# EAGLE design cpu2-c (EAGLE 4.13)
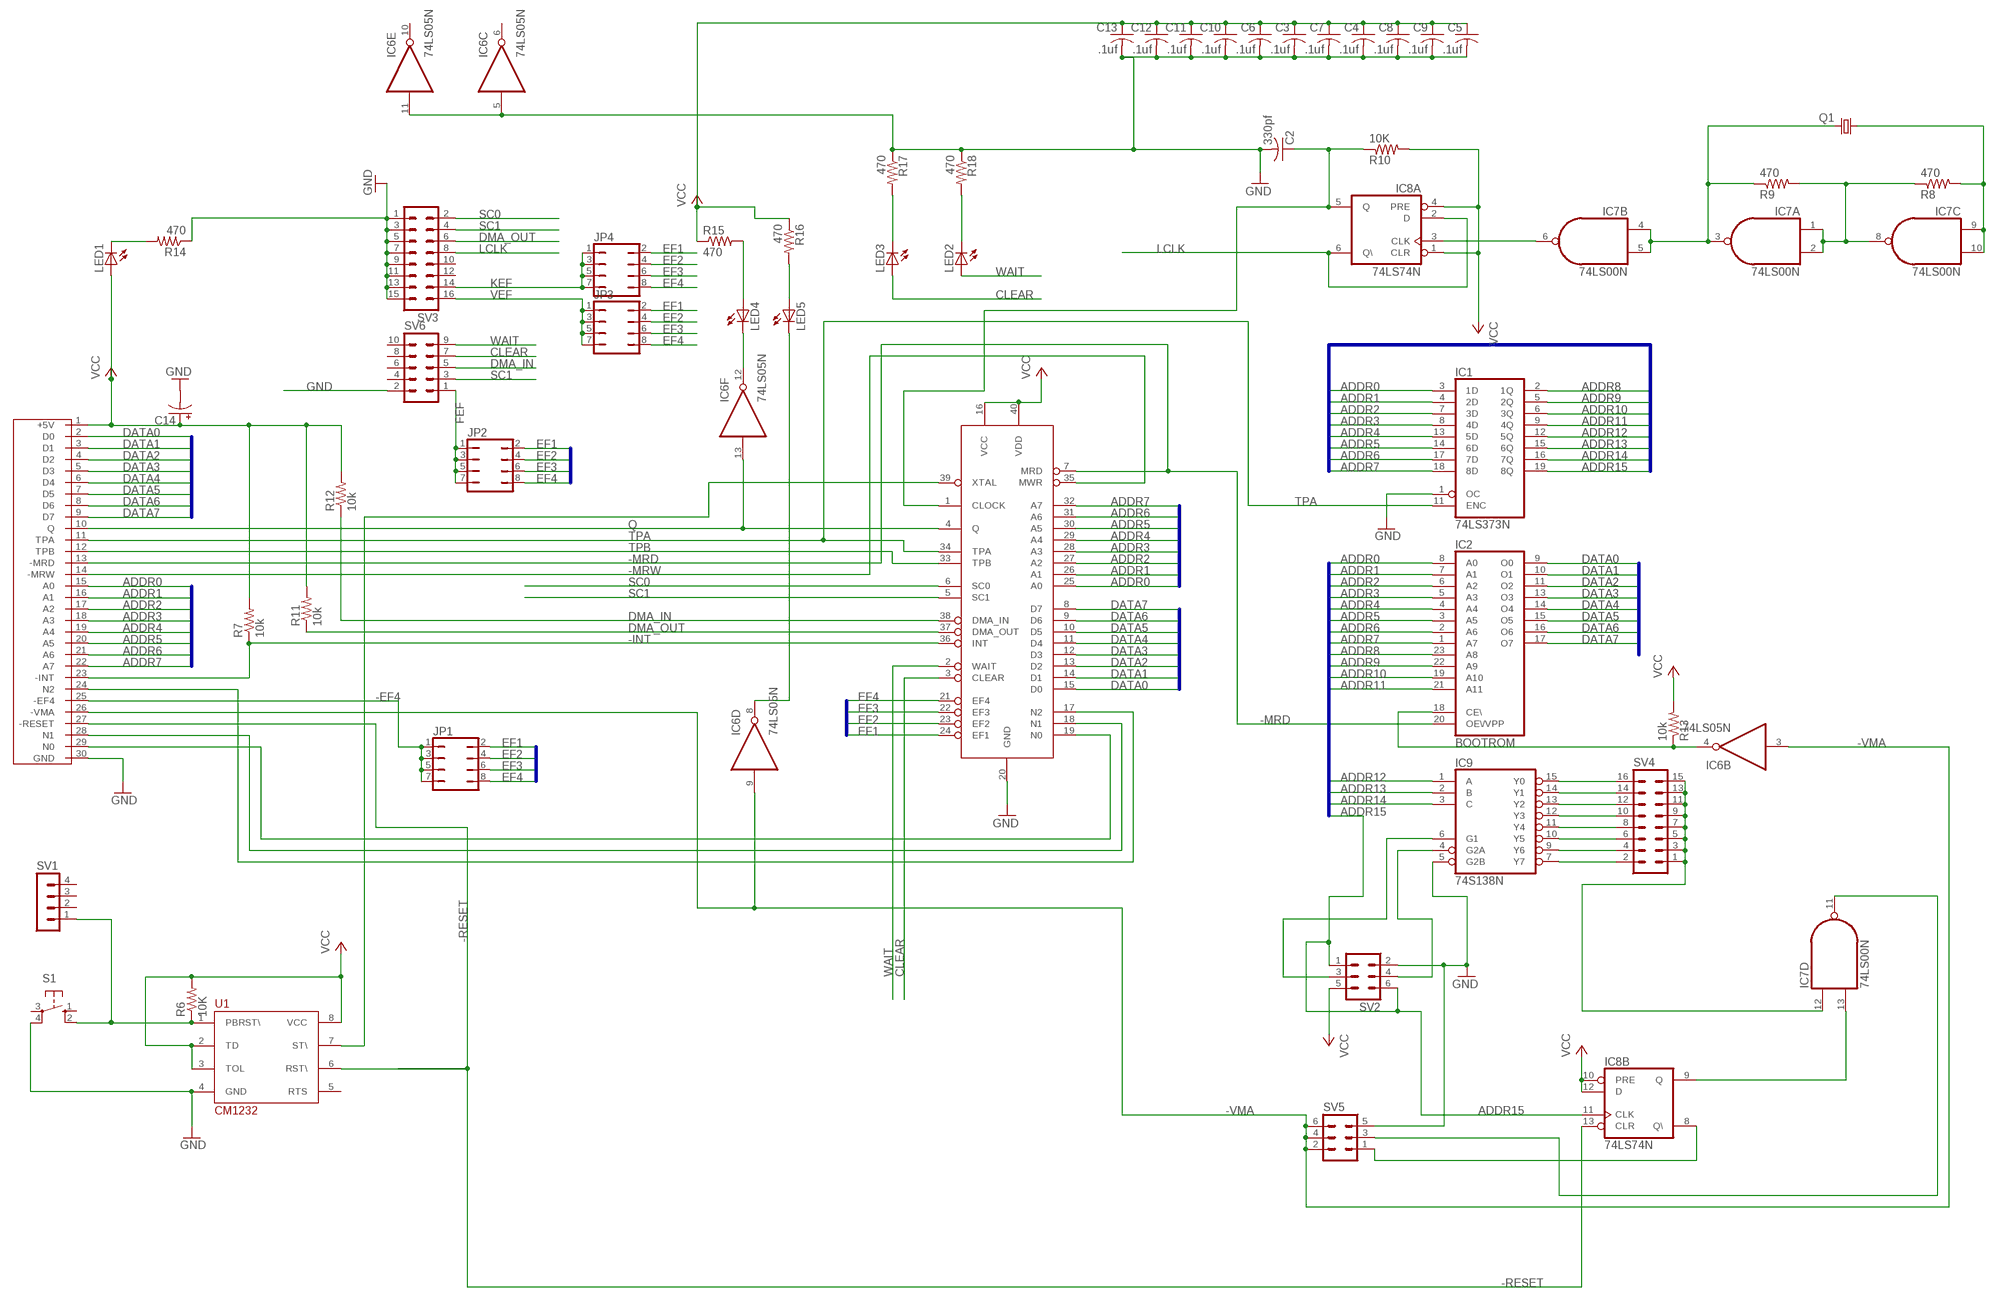
[diagram p0: schematic, sheet 1]

## Parts
C2  330pf  C-US025-025X050  [C025-025X050]
C3  .1uf  C-US025-050X050  [C025-050X050]
C4  .1uf  C-US025-050X050  [C025-050X050]
C5  .1uf  C-US025-050X050  [C025-050X050]
C6  .1uf  C-US025-050X050  [C025-050X050]
C7  .1uf  C-US025-050X050  [C025-050X050]
C8  .1uf  C-US025-050X050  [C025-050X050]
C9  .1uf  C-US025-050X050  [C025-050X050]
C10  .1uf  C-US025-050X050  [C025-050X050]
C11  .1uf  C-US025-050X050  [C025-050X050]
C12  .1uf  C-US025-050X050  [C025-050X050]
C13  .1uf  C-US025-050X050  [C025-050X050]
C14  CPOL-USE2.5-7  [E2,5-7]
IC1  74LS373N  [DIL20]
IC2  BOOTROM  2732  [DIL24]
IC6  74LS05N  [DIL14]
IC7  74LS00N  [DIL14]
IC8  74LS74N  [DIL14]
IC9  74S138N  [DIL16]
JP1  JP4Q  [JP4Q]
JP2  JP4Q  [JP4Q]
JP3  JP4Q  [JP4Q]
JP4  JP4Q  [JP4Q]
LED1  LED5MM  [LED5MM]
LED2  LED5MM  [LED5MM]
LED3  LED5MM  [LED5MM]
LED4  LED5MM  [LED5MM]
LED5  LED5MM  [LED5MM]
Q1  CRYTALHC49U70  [HC49U70]
R6  10K  R-US_0207/2V  [0207/2V]
R7  10k  R-US_0207/2V  [0207/2V]
R8  470  R-US_0207/2V  [0207/2V]
R9  470  R-US_0207/2V  [0207/2V]
R10  10K  R-US_0207/2V  [0207/2V]
R11  10k  R-US_0207/2V  [0207/2V]
R12  10k  R-US_0207/2V  [0207/2V]
R13  10k  R-US_0207/2V  [0207/2V]
R14  470  R-US_0207/7  [0207/7]
R15  470  R-US_0207/7  [0207/7]
R16  470  R-US_0207/7  [0207/7]
R17  470  R-US_0207/7  [0207/7]
R18  470  R-US_0207/7  [0207/7]
S1  10-XX  [B3F-10XX]
SV1  MA04-1  [MA04-1]
SV2  MA03-2  [MA03-2]
SV3  MA08-2  [MA08-2]
SV4  MA08-2  [MA08-2]
SV5  MA03-2  [MA03-2]
SV6  MA05-2  [MA05-2]
U1  CM1232  [DIP-8]
U$1  CDP1802BCECDP1802BCE  [DIL40]
U$2  C30  [C30]

## Nets
-EF4: JP1.1 JP1.3 JP1.5 JP1.7 U$2.25(-EF4)
-INT: R7.1 U$1.36(INT) U$2.23(-INT)
-MRD: IC2.20(OE\/VPP) U$1.7(MRD) U$2.13(-MRD)
-MRW: U$1.35(MWR) U$2.14(-MRW)
-RESET: IC8.13(B:CLR) U1.6(RST\) U$2.27(-RESET)
-VMA: IC6.3(B:I) IC6.9(D:I) SV5.2 SV5.4 SV5.6 U$2.26(-VMA)
ADDR0: IC1.3(1D) IC2.8(A0) U$1.25(A0) U$2.15(A0)
ADDR1: IC1.4(2D) IC2.7(A1) U$1.26(A1) U$2.16(A1)
ADDR2: IC1.7(3D) IC2.6(A2) U$1.27(A2) U$2.17(A2)
ADDR3: IC1.8(4D) IC2.5(A3) U$1.28(A3) U$2.18(A3)
ADDR4: IC1.13(5D) IC2.4(A4) U$1.29(A4) U$2.19(A4)
ADDR5: IC1.14(6D) IC2.3(A5) U$1.30(A5) U$2.20(A5)
ADDR6: IC1.17(7D) IC2.2(A6) U$1.31(A6) U$2.21(A6)
ADDR7: IC1.18(8D) IC2.1(A7) U$1.32(A7) U$2.22(A7)
ADDR8: IC1.2(1Q) IC2.23(A8)
ADDR9: IC1.5(2Q) IC2.22(A9)
ADDR10: IC1.6(3Q) IC2.19(A10)
ADDR11: IC1.9(4Q) IC2.21(A11)
ADDR12: IC1.12(5Q) IC9.1(A)
ADDR13: IC1.15(6Q) IC9.2(B)
ADDR14: IC1.16(7Q) IC9.3(C)
ADDR15: IC1.19(8Q) IC8.11(B:CLK) SV2.1 SV2.6
CLEAR: LED3.A SV6.7 U$1.3(CLEAR)
DATA0: IC2.9(O0) U$1.15(D0) U$2.2(D0)
DATA1: IC2.10(O1) U$1.14(D1) U$2.3(D1)
DATA2: IC2.11(O2) U$1.13(D2) U$2.4(D2)
DATA3: IC2.13(O3) U$1.12(D3) U$2.5(D3)
DATA4: IC2.14(O4) U$1.11(D4) U$2.6(D4)
DATA5: IC2.15(O5) U$1.10(D5) U$2.7(D5)
DATA6: IC2.16(O6) U$1.9(D6) U$2.8(D6)
DATA7: IC2.17(O7) U$1.8(D7) U$2.9(D7)
DMA_IN: R12.1 SV6.5 U$1.38(DMA_IN)
DMA_OUT: R11.1 SV3.6 U$1.37(DMA_OUT)
EF1: JP1.2 JP2.2 JP3.2 JP4.2 U$1.24(EF1)
EF2: JP1.4 JP2.4 JP3.4 JP4.4 U$1.23(EF2)
EF3: JP1.6 JP2.6 JP3.6 JP4.6 U$1.22(EF3)
EF4: JP1.8 JP2.8 JP3.8 JP4.8 U$1.21(EF4)
FEF: JP2.1 JP2.3 JP2.5 JP2.7 SV6.1
GND: C2.2 C3.2 C4.2 C5.2 C6.2 C7.2 C8.2 C9.2 C10.2 C11.2 C12.2 C13.2 C14.- IC1.1(OC) IC6.5(C:I) IC6.11(E:I) IC9.5(G2B) R14.1 R17.1 R18.1 S1.4(P1) SV2.2 SV3.1 SV3.3 SV3.5 SV3.7 SV3.9 SV3.11 SV3.13 SV3.15 SV5.5 SV6.2 U1.4(GND) U$1.20(GND) U$2.30(GND)
KEF: JP4.1 JP4.3 JP4.5 JP4.7 SV3.14
LCLK: IC8.2(A:D) IC8.6(A:Q\) SV3.8
N0: U$1.19(N0) U$2.29(N0)
N1: U$1.18(N1) U$2.28(N1)
N2: U$1.17(N2) U$2.24(N2)
N$1: IC7.11(D:O) SV5.3
N$2: R6.1 S1.2(S1) SV1.1 U1.1(PBRST\)
N$3: IC2.18(CE\) IC6.4(B:O) R13.1
N$4: IC7.13(D:I1) IC8.9(B:Q)
N$5: LED1.K(C) R14.2
N$6: IC8.8(B:Q\) SV5.1
N$7: IC6.12(F:O) LED4.K(C)
N$8: LED4.A R15.2
N$9: LED3.K(C) R17.2
N$10: LED2.K(C) R18.2
N$13: LED5.A R16.2
N$14: U1.7(ST\) U$1.39(XTAL)
N$16: IC7.1(A:I0) IC7.2(A:I1) IC7.8(C:O) R8.1 R9.2
N$18: IC7.3(A:O) IC7.4(B:I0) IC7.5(B:I1) Q1.2 R9.1
N$20: IC9.4(G2A) SV2.4
N$21: IC7.9(C:I0) IC7.10(C:I1) Q1.1 R8.2
N$23: IC7.6(B:O) IC8.3(A:CLK)
N$25: IC6.8(D:O) LED5.K(C)
N$27: C2.1 IC8.5(A:Q) R10.1 U$1.1(CLOCK)
N$29: IC9.15(Y0) SV4.16
N$30: IC9.14(Y1) SV4.14
N$31: IC9.13(Y2) SV4.12
N$32: IC9.12(Y3) SV4.10
N$33: IC9.11(Y4) SV4.8
N$34: IC9.10(Y5) SV4.6
N$35: IC9.9(Y6) SV4.4
N$36: IC9.7(Y7) SV4.2
N$37: IC7.12(D:I0) SV4.1 SV4.3 SV4.5 SV4.7 SV4.9 SV4.11 SV4.13 SV4.15
N$38: IC9.6(G1) SV2.3
Q: IC6.13(F:I) U$1.4(Q) U$2.10(Q)
SC0: SV3.2 U$1.6(SC0)
SC1: SV3.4 SV6.3 U$1.5(SC1)
TPA: IC1.11(ENC) U$1.34(TPA) U$2.11(TPA)
TPB: U$1.33(TPB) U$2.12(TPB)
VCC: C3.1 C4.1 C5.1 C6.1 C7.1 C8.1 C9.1 C10.1 C11.1 C12.1 C13.1 C14.+ IC8.1(A:CLR) IC8.4(A:PRE) IC8.10(B:PRE) IC8.12(B:D) LED1.A R6.2 R7.2 R10.2 R11.2 R12.2 R13.2 R15.1 R16.1 SV2.5 U1.2(TD) U1.3(TOL) U1.8(VCC) U$1.16(VCC) U$1.40(VDD) U$2.1(+5V)
VEF: JP3.1 JP3.3 JP3.5 JP3.7 SV3.16
WAIT: LED2.A SV6.9 U$1.2(WAIT)
Unconnected: IC6.1(A:I) IC6.2(A:O) IC6.6(C:O) IC6.10(E:O) S1.1(S) S1.3(P) SV1.2 SV1.3 SV1.4 SV3.10 SV3.12 SV6.4 SV6.6 SV6.8 SV6.10 U1.5(RTS)

## Buses
DATA[0..7]
ADDR[0..15]
EF[1..4]

## Power pins joined to a net without a drawn wire
GND: IC1.10(GND) IC2.12(GND) IC6.7(P:GND) IC7.7(P:GND) IC8.7(P:GND) IC9.8(GND)
VCC: IC1.20(VCC) IC2.24(VCC) IC6.14(P:VCC) IC7.14(P:VCC) IC8.14(P:VCC) IC9.16(VCC)

## Library data of the parts
C2-C13 = rcl:C-US: CAPACITOR, American symbol
C14 = rcl:CPOL-US: POLARIZED CAPACITOR, American symbol
IC1 = 74xx-us:74*373: Octal D type transparent LATCH, edge triggered
IC2 = memory:2732: MEMORY
IC6 = 74xx-us:74*05: Hex INVERTER, open collector
IC7 = 74xx-us:74*00: Quad 2-input NAND gate
IC8 = 74xx-us:74*74: Dual D type positive edge triggered FLIP FLOP, preset and clear
IC9 = 74xx-us:74*138: 3-line to 8-line DECODER/DEMULTIPLEXER
JP1-JP4 = jumper:JP4Q: JUMPER
LED1-LED5 = led:LED: LED OSRAM: - CHIPLED LG R971, LG N971, LY N971, LG Q971, LY Q971, LO R971, LY R971 LH N974, LH R974 LS Q976, LO Q976, LY Q976 LO Q996 - Hyper CHIPLED LW Q18S LB Q993, LB Q99A, LB R99A - SideLED LS A670, LO A670, LY A670, LG A670, LP A670 LB A673, LV A673, LT A673, LW A673 LH A674 LY A675 LS A676, LA A676, LO A676, LY A676, LW A676 LS A679, LY A679, LG A679 - Hyper Micro SIDELED® LS Y876, LA Y876, LO Y876, LY Y876 LT Y87S - SmartLED LW L88C, LW L88S LB L89C, LB L89S, LG L890 LS L89K, LO L89K, LY L89K LS L896, LA L896, LO L896, LY L896 - TOPLED LS T670, LO T670, LY T670, LG T670, LP T670 LSG T670, LSP T670, LSY T670, LOP T670, LYG T670 LG T671, LOG T671, LSG T671 LB T673, LV T673, LT T673, LW T673 LH T674 LS T676, LA T676, LO T676, LY T676, LB T676, LH T676, LSB T676, LW T676 LB T67C, LV T67C, LT T67C, LS T67K, LO T67K, LY T67K, LW E67C LS E67B, LA E67B, LO E67B, LY E67B, LB E67C, LV E67C, LT E67C LW T67C LS T679, LY T679, LG T679 LS T770, LO T770, LY T770, LG T770, LP T770 LB T773, LV T773, LT T773, LW T773 LH T774 LS E675, LA E675, LY E675, LS T675 LS T776, LA T776, LO T776, LY T776, LB T776 LHGB T686 LT T68C, LB T68C - Hyper Mini TOPLED® LB M676 - Mini TOPLED Santana® LG M470 LS M47K, LO M47K, LY M47K Source: http://www.osram.convergy.de/
Q1 = crystal:CRYTAL: CRYSTAL
R6-R18 = rcl:R-US_: RESISTOR, American symbol
S1 = switch-omron:10-XX: OMRON SWITCH
SV1 = con-lstb:MA04-1: PIN HEADER
SV2 SV5 = con-lstb:MA03-2: PIN HEADER
SV3 SV4 = con-lstb:MA08-2: PIN HEADER
SV6 = con-lstb:MA05-2: PIN HEADER
U1 = 65xxx:CM1232: CM1232 CMOS Microprocessor Monitor
U$1 = cdp:CDP1802BCE
U$2 = k1:C30

## Board
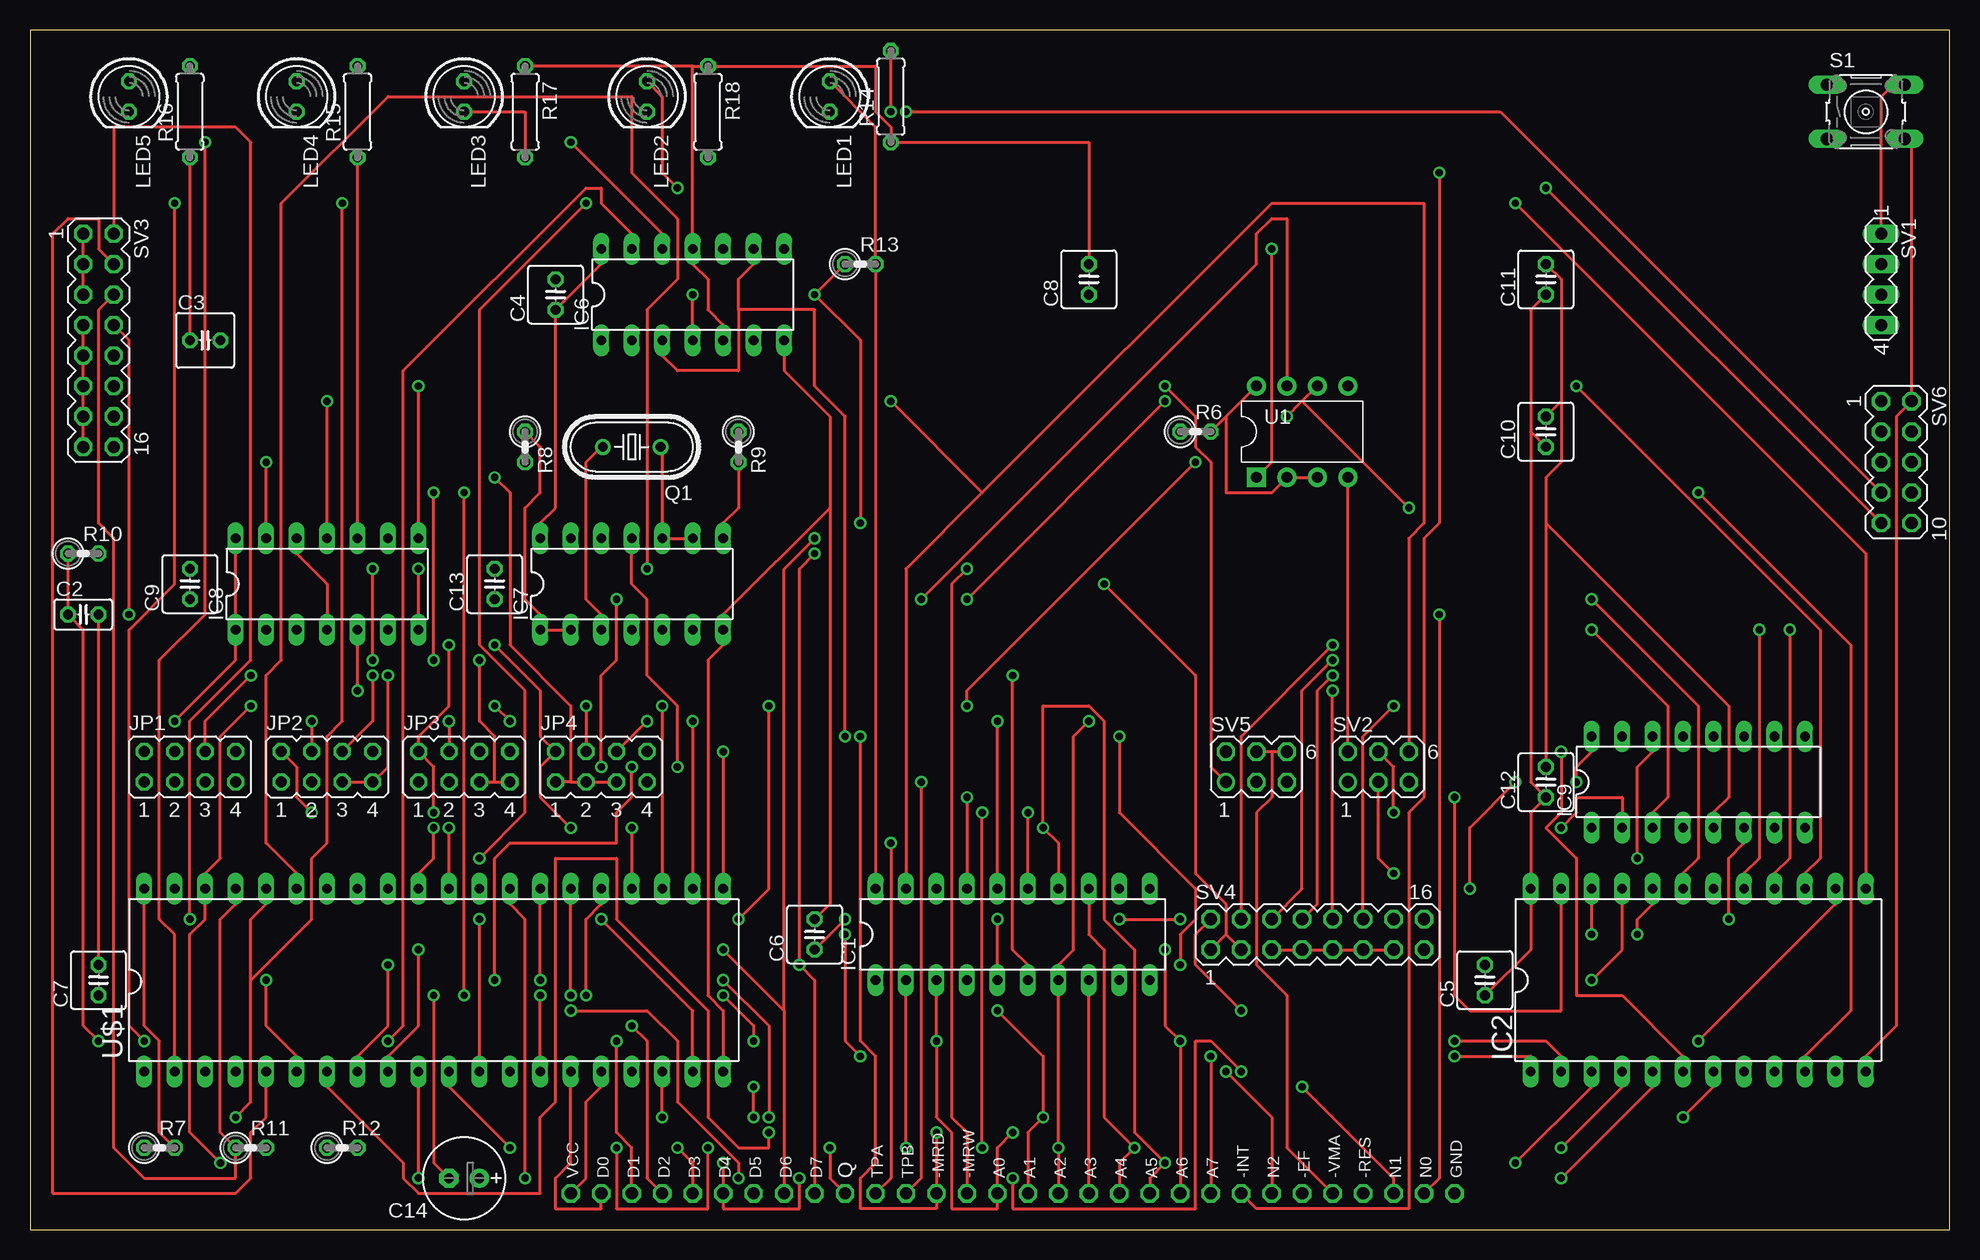
[diagram p1: board, top side]
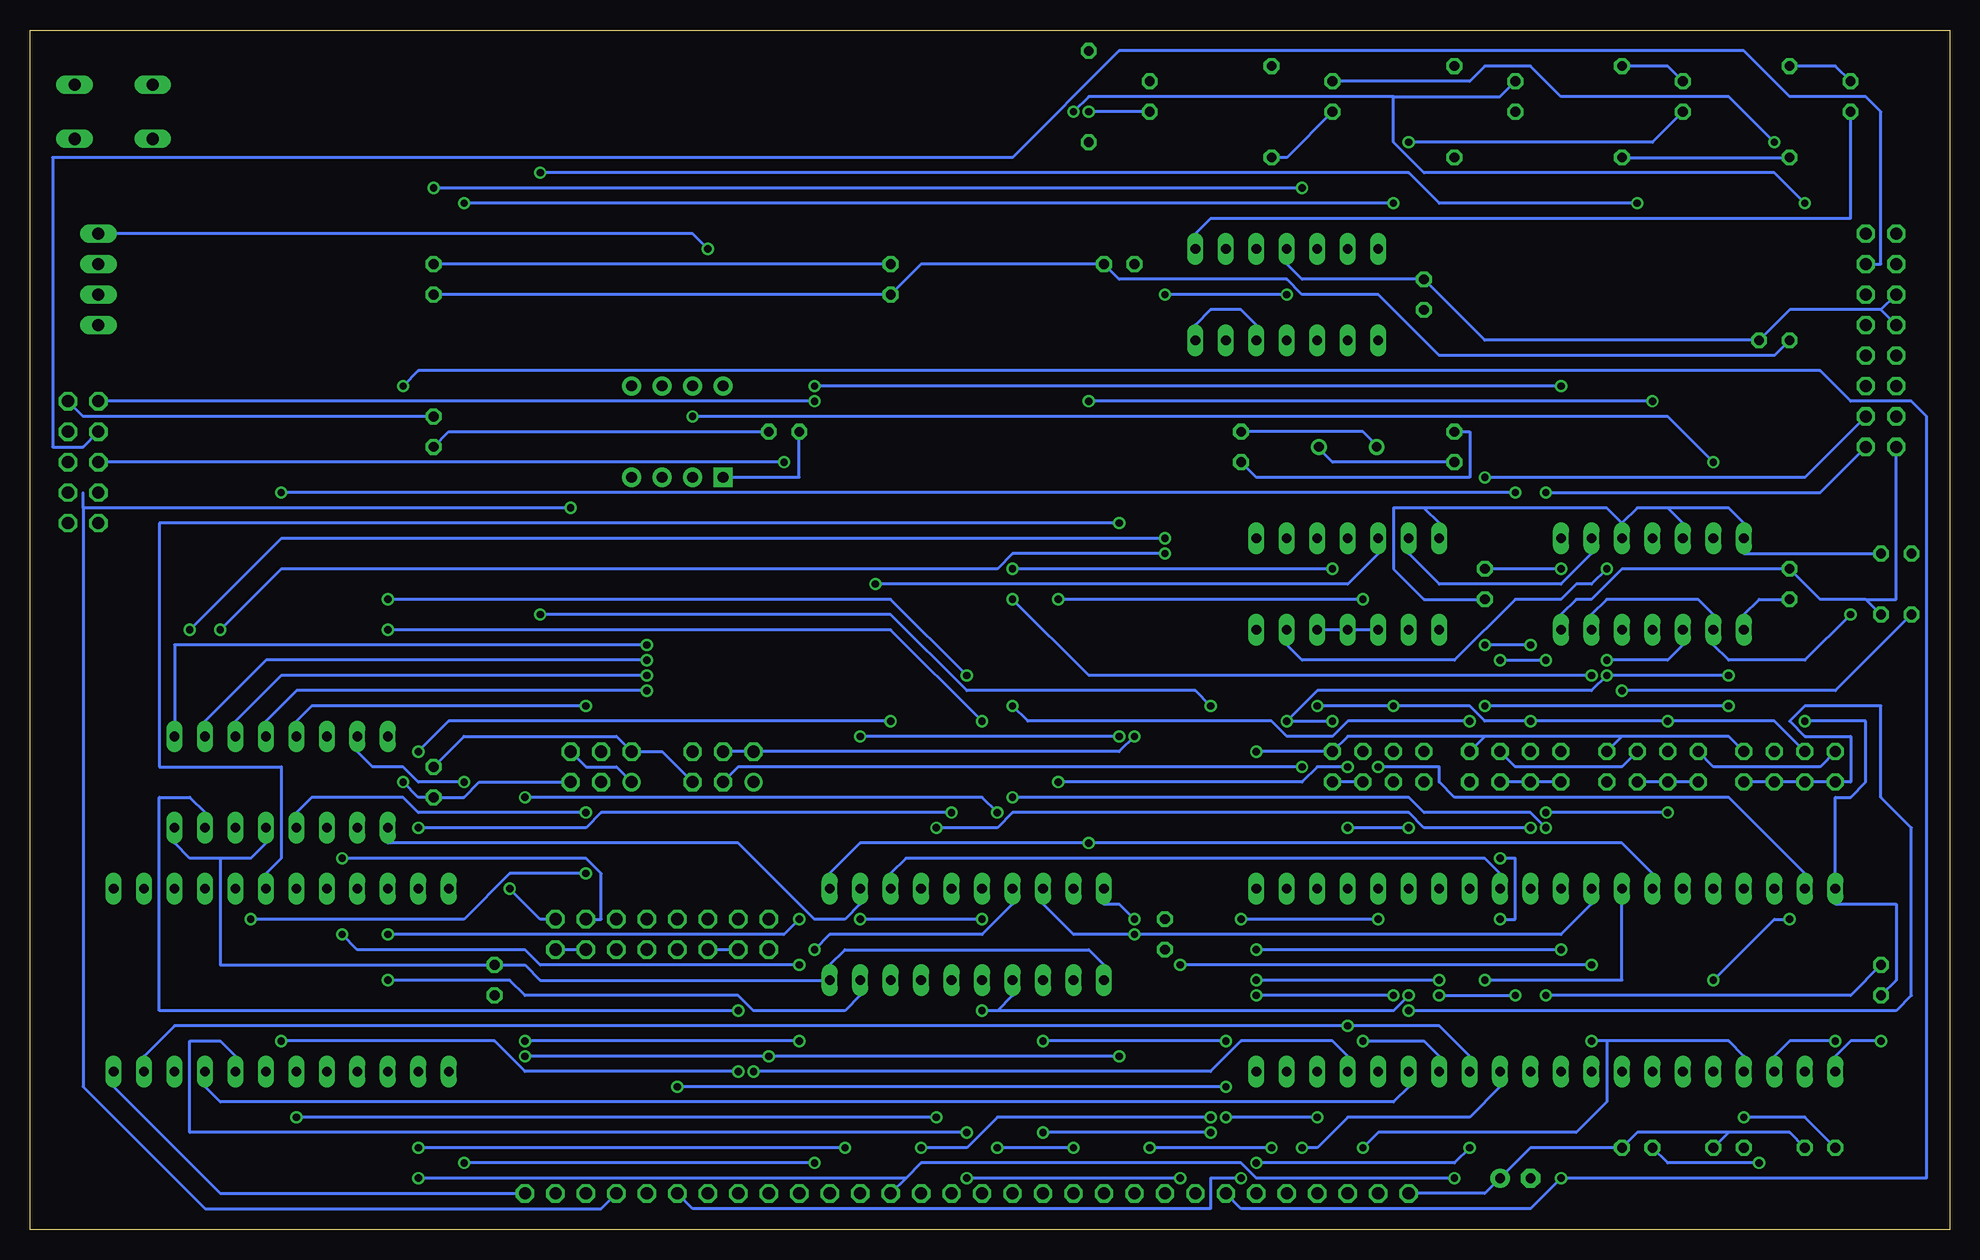
[diagram p2: board, bottom side, seen from below]

Size 160 x 100 mm. Coordinates in mm from the lower left corner, seen from the top.
Outline: 0,0 160,0 160,100 0,100 0,0
Copper layers (1*16): Top 0.035mm / dielectric 1.5mm / Bottom 0.035mm
Design rules "default": minimum track width 10mil, minimum drill 24mil, track to track 8mil, track to pad 8mil, pad to pad 8mil, via to via 8mil, smd to smd 8mil, copper to edge 40mil, drill to drill 8mil, minimum pad ring 10mil, minimum via ring 8mil, stop-mask expansion 4mil, vias tented up to drill 0mil, thermal gap 10mil

### Footprints (pad centres in the part's own frame; a part is rotated, then mirrored left to right if it is on the bottom)
C025-025X050 = drill 0.813 octagon: 1 -1.27,0; 2 1.27,0
C025-050X050 = drill 0.813 octagon: 1 -1.27,0; 2 1.27,0
E2,5-7 = drill 0.813 pad 1.6 round: + -1.27,0 | drill 0.813 pad 1.6 octagon: - 1.27,0
DIL20 = drill 0.813 long: 1 -11.43,-3.81; 2 -8.89,-3.81; 3 -6.35,-3.81; 4 -3.81,-3.81; 5 -1.27,-3.81; 6 1.27,-3.81; 7 3.81,-3.81; 8 6.35,-3.81; 9 8.89,-3.81; 10 11.43,-3.81; 11 11.43,3.81; 12 8.89,3.81; 13 6.35,3.81; 14 3.81,3.81; 15 1.27,3.81; 16 -1.27,3.81; 17 -3.81,3.81; 18 -6.35,3.81; 19 -8.89,3.81; 20 -11.43,3.81
DIL24 = drill 0.813 long: 1 -13.97,-7.62; 2 -11.43,-7.62; 3 -8.89,-7.62; 4 -6.35,-7.62; 5 -3.81,-7.62; 6 -1.27,-7.62; 7 1.27,-7.62; 8 3.81,-7.62; 9 6.35,-7.62; 10 8.89,-7.62; 11 11.43,-7.62; 12 13.97,-7.62; 13 13.97,7.62; 14 11.43,7.62; 15 8.89,7.62; 16 6.35,7.62; 17 3.81,7.62; 18 1.27,7.62; 19 -1.27,7.62; 20 -3.81,7.62; 21 -6.35,7.62; 22 -8.89,7.62; 23 -11.43,7.62; 24 -13.97,7.62
DIL14 = drill 0.813 long: 1 -7.62,-3.81; 2 -5.08,-3.81; 3 -2.54,-3.81; 4 0,-3.81; 5 2.54,-3.81; 6 5.08,-3.81; 7 7.62,-3.81; 8 7.62,3.81; 9 5.08,3.81; 10 2.54,3.81; 11 0,3.81; 12 -2.54,3.81; 13 -5.08,3.81; 14 -7.62,3.81
DIL16 = drill 0.813 long: 1 -8.89,-3.81; 2 -6.35,-3.81; 3 -3.81,-3.81; 4 -1.27,-3.81; 5 1.27,-3.81; 6 3.81,-3.81; 7 6.35,-3.81; 8 8.89,-3.81; 9 8.89,3.81; 10 6.35,3.81; 11 3.81,3.81; 12 1.27,3.81; 13 -1.27,3.81; 14 -3.81,3.81; 15 -6.35,3.81; 16 -8.89,3.81
JP4Q = drill 0.914 octagon: 1 -3.81,-1.27; 2 -3.81,1.27; 3 -1.27,-1.27; 4 -1.27,1.27; 5 1.27,-1.27; 6 1.27,1.27; 7 3.81,-1.27; 8 3.81,1.27
LED5MM = drill 0.813 octagon: A -1.27,0; K 1.27,0
HC49U70 = drill 0.813 round: 1 -2.413,0; 2 2.413,0
0207/2V = drill 0.813 octagon: 1 -1.27,0; 2 1.27,0
0207/7 = drill 0.813 octagon: 1 -3.81,0; 2 3.81,0
B3F-10XX = drill 1.016 long: 1 -3.251,2.261; 2 3.251,2.261; 3 -3.251,-2.261; 4 3.251,-2.261
MA04-1 = drill 1.016 long: 1 -3.81,0; 2 -1.27,0; 3 1.27,0; 4 3.81,0
MA03-2 = drill 1.016 round: 1 -2.54,-1.27 | drill 1.016 octagon: 2 -2.54,1.27; 3 0,-1.27; 4 0,1.27; 5 2.54,-1.27; 6 2.54,1.27
MA08-2 = drill 1.016 octagon: 1 -8.89,-1.27; 2 -8.89,1.27; 3 -6.35,-1.27; 4 -6.35,1.27; 5 -3.81,-1.27; 6 -3.81,1.27; 7 -1.27,-1.27; 8 -1.27,1.27; 9 1.27,-1.27; 10 1.27,1.27; 11 3.81,-1.27; 12 3.81,1.27; 13 6.35,-1.27; 14 6.35,1.27; 15 8.89,-1.27; 16 8.89,1.27
MA05-2 = drill 1.016 octagon: 1 -5.08,-1.27; 2 -5.08,1.27; 3 -2.54,-1.27; 4 -2.54,1.27; 5 0,-1.27; 6 0,1.27; 7 2.54,-1.27; 8 2.54,1.27; 9 5.08,-1.27; 10 5.08,1.27
DIP-8 = drill 0.889 pad 1.6 square: 1 -2.54,-2.54 | drill 0.889 pad 1.6 round: 2 0,-2.54; 3 2.54,-2.54; 4 5.08,-2.54; 5 5.08,5.08; 6 2.54,5.08; 7 0,5.08; 8 -2.54,5.08
DIL40 = drill 0.813 long: 1 -24.13,-7.62; 2 -21.59,-7.62; 3 -19.05,-7.62; 4 -16.51,-7.62; 5 -13.97,-7.62; 6 -11.43,-7.62; 7 -8.89,-7.62; 8 -6.35,-7.62; 9 -3.81,-7.62; 10 -1.27,-7.62; 11 1.27,-7.62; 12 3.81,-7.62; 13 6.35,-7.62; 14 8.89,-7.62; 15 11.43,-7.62; 16 13.97,-7.62; 17 16.51,-7.62; 18 19.05,-7.62; 19 21.59,-7.62; 20 24.13,-7.62; 21 24.13,7.62; 22 21.59,7.62; 23 19.05,7.62; 24 16.51,7.62; 25 13.97,7.62; 26 11.43,7.62; 27 8.89,7.62; 28 6.35,7.62; 29 3.81,7.62; 30 1.27,7.62; 31 -1.27,7.62; 32 -3.81,7.62; 33 -6.35,7.62; 34 -8.89,7.62; 35 -11.43,7.62; 36 -13.97,7.62; 37 -16.51,7.62; 38 -19.05,7.62; 39 -21.59,7.62; 40 -24.13,7.62
C30 = drill 1.016 octagon: 1 -36.83,0; 2 -34.29,0; 3 -31.75,0; 4 -29.21,0; 5 -26.67,0; 6 -24.13,0; 7 -21.59,0; 8 -19.05,0; 9 -16.51,0; 10 -13.97,0; 11 -11.43,0; 12 -8.89,0; 13 -6.35,0; 14 -3.81,0; 15 -1.27,0; 16 1.27,0; 17 3.81,0; 18 6.35,0; 19 8.89,0; 20 11.43,0; 21 13.97,0; 22 16.51,0; 23 19.05,0; 24 21.59,0; 25 24.13,0; 26 26.67,0; 27 29.21,0; 28 31.75,0; 29 34.29,0; 30 36.83,0

### Placement (x,y rotation side)
C2  4.44,51.27 0 top
C3  14.6,74.13 0 top
C4  43.81,77.94 90 top
C5  121.28,20.79 90 top
C6  65.4,24.6 90 top
C7  5.71,20.79 90 top
C8  88.26,79.21 90 top
C9  13.33,53.81 90 top
C10  126.36,66.51 90 top
C11  126.36,79.21 90 top
C12  126.36,37.3 90 top
C13  38.73,53.81 90 top
C14  36.19,4.28 180 top
IC1  81.91,24.6 0 top
IC2  139.06,20.79 0 top
IC6  55.24,77.94 0 top
IC7  50.16,53.81 0 top
IC8  24.76,53.81 0 top
IC9  139.06,37.3 0 top
JP1  13.33,38.57 0 top
JP2  24.76,38.57 0 top
JP3  36.19,38.57 0 top
JP4  47.62,38.57 0 top
LED1  66.67,94.45 270 top
LED2  51.43,94.45 270 top
LED3  36.19,94.45 270 top
LED4  22.22,94.45 270 top
LED5  8.25,94.45 270 top
Q1  50.16,65.24 180 top
R6  97.15,66.51 0 top
R7  10.79,6.82 0 top
R8  41.27,65.24 270 top
R9  59.05,65.24 270 top
R10  4.44,56.35 0 top
R11  18.41,6.82 0 top
R12  26.03,6.82 0 top
R13  69.21,80.48 0 top
R14  71.75,94.45 90 top
R15  27.3,93.18 90 top
R16  13.33,93.18 90 top
R17  41.27,93.18 270 top
R18  56.51,93.18 270 top
S1  153.03,93.18 0 top
SV1  154.3,79.21 270 top
SV2  112.39,38.57 0 top
SV3  5.71,74.13 270 top
SV4  107.31,24.6 0 top
SV5  102.23,38.57 0 top
SV6  155.57,63.97 270 top
U1  104.77,65.24 0 top
U$1  33.65,20.79 0 top
U$2  81.91,3.01 0 top

### Tracks (layer width: path | path; a pad name or v marks a point on that pad's centre or on a via)
-EF4  (via drill 0.61)
  Top 0.254: v59.05,4.28 59.05,5.55 53.97,10.63 53.97,15.71 51.43,18.25 v45.08,18.25
  Bottom 0.254: JP1.7 JP1.5 JP1.3 JP1.1 8.25,37.3 8.25,41.11 12.06,41.11 13.33,42.38 12.06,43.65 5.71,43.65 5.71,36.03 3.17,33.49 3.17,19.52 4.44,18.25 v45.08,18.25 | U$2.25 104.77,1.74 61.59,1.74 61.59,4.28 v59.05,4.28
-INT  (via drill 0.61)
  Top 0.254: v17.14,9.36 18.41,10.63 18.41,20.79 | 18.41,20.79 18.41,25.87 19.68,27.14 U$1.36 | U$2.23 102.23,1.74 114.93,1.74 114.93,34.76 116.2,36.03 116.2,57.62 117.47,58.89 v117.47,88.1 | v26.03,85.56 26.03,42.38 24.76,41.11 24.76,32.22 23.49,30.95 23.49,25.87 18.41,20.79
  Bottom 0.254: R7.1 12.06,9.36 v17.14,9.36 | v117.47,88.1 45.08,88.1 42.54,85.56 v26.03,85.56
-MRD  (via drill 0.61)
  Top 0.254: v61.59,8.09 61.59,6.82 59.05,6.82 56.51,9.36 56.51,18.25 48.89,25.87 48.89,30.95 43.81,30.95 43.81,10.63 42.54,9.36 42.54,3.01 32.38,3.01 31.11,4.28 31.11,5.55 24.76,11.9 U$1.7 | v75.56,8.09 U$2.13 75.56,1.74 69.21,1.74 69.21,4.28 70.48,5.55 70.48,14.44 69.21,15.71 v69.21,41.11 | v133.98,24.6 133.98,25.87 135.25,27.14 IC2.20 | v95.88,22.06 95.88,24.6 97.15,25.87 97.15,28.41 90.8,34.76 v90.8,41.11
  Bottom 0.254: v61.59,8.09 v75.56,8.09 | v133.98,24.6 132.71,23.33 118.74,23.33 117.47,22.06 v95.88,22.06 | v69.21,41.11 v90.8,41.11
-MRW  (via drill 0.61)
  Top 0.254: v51.43,55.08 51.43,76.67 53.97,79.21 53.97,84.29 50.16,88.1 50.16,94.45 29.84,94.45 20.95,85.56 20.95,47.46 19.68,46.19 19.68,32.22 22.22,29.68 U$1.35 | v78.1,55.08 76.83,53.81 76.83,9.36 78.1,8.09 U$2.14
  Bottom 0.254: v51.43,55.08 v78.1,55.08
-RESET  (via drill 0.61)
  Top 0.254: 106.04,69.05 U1.6 | v104.77,67.78 106.04,69.05 | IC8.13 v19.68,63.97 | 106.04,69.05 v114.93,60.16
  Bottom 0.254: v19.68,63.97 23.49,67.78 v104.77,67.78 | U$2.27 112.39,1.74 145.41,1.74 155.57,11.9 155.57,60.16 | 155.57,60.16 155.57,61.43 | v114.93,60.16 155.57,60.16
-VMA  (via drill 0.61)
  Top 0.254: 59.05,76.67 59.05,79.21 60.32,80.48 IC6.9 | 59.05,76.67 59.05,71.59 53.97,71.59 52.7,72.86 IC6.3 | SV5.4 103.5,39.84 | 103.5,39.84 SV5.6 | U$2.26 104.77,6.82 104.77,19.52 102.23,22.06 102.23,34.76 103.5,36.03 103.5,39.84 | 59.05,76.67 65.4,76.67 65.4,70.32 67.94,67.78 v67.94,41.11
  Bottom 0.254: SV5.4 SV5.2 69.21,39.84 v67.94,41.11
ADDR0  (via drill 0.61)
  Top 0.254: v81.91,8.09 80.64,6.82 U$2.15 80.64,1.74 76.83,1.74 76.83,8.09 75.56,9.36 v75.56,15.71 IC1.3 | v46.35,19.52 46.35,25.87 47.62,27.14 U$1.25 | v57.78,19.52 60.32,16.98 v60.32,15.71
  Bottom 0.254: v81.91,8.09 146.68,8.09 146.68,15.71 144.14,15.71 142.87,14.44 IC2.8 | v46.35,19.52 v57.78,19.52 | v60.32,15.71 v75.56,15.71
ADDR1  (via drill 0.61)
  Top 0.254: v137.79,9.36 140.33,11.9 IC2.7 | U$2.16 83.18,8.09 v84.45,9.36 84.45,14.44 v80.64,18.25 | v45.08,19.52 U$1.26
  Bottom 0.254: v84.45,9.36 v137.79,9.36 | 79.37,18.25 78.1,19.52 IC1.4 | 79.37,18.25 v80.64,18.25 | v45.08,19.52 46.35,18.25 79.37,18.25
ADDR2  (via drill 0.61)
  Top 0.254: U$2.17 v85.72,6.82 IC1.7 85.72,22.06 86.99,23.33 86.99,41.11 v88.26,42.38 | v57.78,20.79 61.59,16.98 v61.59,9.36 | v42.54,20.79 U$1.27 | v127.63,39.84 127.63,34.76 126.36,33.49 128.9,30.95 128.9,19.52 132.71,19.52 137.79,14.44 IC2.6
  Bottom 0.254: v42.54,20.79 v57.78,20.79 | v61.59,9.36 79.37,9.36 81.91,6.82 v85.72,6.82 | v127.63,39.84 125.09,42.38 v88.26,42.38
ADDR3  (via drill 0.61)
  Top 0.254: U$2.18 IC1.8 | v41.27,4.28 41.27,25.87 40,27.14 U$1.28 | v127.63,4.28 135.25,11.9 IC2.5
  Bottom 0.254: v41.27,4.28 57.78,4.28 59.05,5.55 85.72,5.55 86.99,4.28 | 86.99,4.28 U$2.18 | 86.99,4.28 v127.63,4.28
ADDR4  (via drill 0.61)
  Top 0.254: v127.63,6.82 132.71,11.9 IC2.4 | U$2.19 90.8,5.55 v92.07,6.82 89.53,9.36 89.53,23.33 88.26,24.6 IC1.13
  Bottom 0.254: U$1.29 37.46,29.68 38.73,30.95 86.99,30.95 88.26,29.68 IC1.13 | v92.07,6.82 v127.63,6.82
ADDR5  (via drill 0.61)
  Top 0.254: v123.82,5.55 130.17,11.9 IC2.3 | U$2.20 93.34,4.28 v94.61,5.55 92.07,8.09 92.07,23.33 89.53,25.87 89.53,42.38 88.26,43.65 84.45,43.65 v84.45,33.49 85.72,32.22 IC1.14 | U$1.30 v34.92,33.49
  Bottom 0.254: v94.61,5.55 v123.82,5.55 | v34.92,33.49 43.81,33.49 45.08,34.76 78.1,34.76 79.37,33.49 v84.45,33.49
ADDR6  (via drill 0.61)
  Top 0.254: v118.74,15.71 126.36,15.71 127.63,14.44 IC2.2 | U$2.21 v95.88,15.71 94.61,16.98 v94.61,23.33 | v33.65,33.49 33.65,30.95 32.38,29.68 U$1.31 | v78.1,36.03 IC1.17
  Bottom 0.254: v95.88,15.71 v118.74,15.71 | v33.65,33.49 34.92,34.76 43.81,34.76 45.08,36.03 v78.1,36.03 | v94.61,23.33 93.34,24.6 80.64,24.6 78.1,27.14 IC1.17
ADDR7  (via drill 0.61)
  Top 0.254: v118.74,14.44 125.09,14.44 IC2.1 | v98.42,14.44 U$2.22 | v69.21,14.44 67.94,15.71 v67.94,24.6
  Bottom 0.254: v118.74,14.44 v98.42,14.44 v69.21,14.44 | U$1.32 29.84,27.14 32.38,24.6 v67.94,24.6 73.02,24.6 75.56,27.14 IC1.18
ADDR8  (via drill 0.61)
  Top 0.254: v79.37,6.82 v79.37,34.76 | v118.74,36.03 118.74,19.52 120.01,18.25 127.63,18.25 IC2.23 | v73.02,6.82 IC1.2
  Bottom 0.254: v73.02,6.82 v79.37,6.82 | v79.37,34.76 80.64,36.03 v118.74,36.03
ADDR9  (via drill 0.61)
  Top 0.254: v90.8,25.87 v95.88,25.87 | IC1.5 v80.64,25.87 | v130.17,24.6 IC2.22
  Bottom 0.254: v80.64,25.87 v90.8,25.87 | v95.88,25.87 97.15,24.6 v130.17,24.6
ADDR10  (via drill 0.61)
  Top 0.254: v81.91,46.19 81.91,23.33 83.18,22.06 IC1.6 | v130.17,52.54 139.06,43.65 139.06,30.95 137.79,29.68 IC2.19
  Bottom 0.254: v81.91,46.19 88.26,52.54 v130.17,52.54
ADDR11  (via drill 0.61)
  Top 0.254: v130.17,20.79 132.71,23.33 IC2.21
  Bottom 0.254: v130.17,20.79 120.01,20.79 118.74,19.52 100.96,19.52 99.69,18.25 92.07,18.25 90.8,19.52 IC1.9
ADDR12
  Bottom 0.254: IC1.12 90.8,27.14 92.07,25.87 94.61,25.87 100.96,32.22 130.17,32.22 IC9.1
ADDR13  (via drill 0.61)
  Top 0.254: v127.63,33.49 128.9,34.76 128.9,36.03 132.71,36.03 IC9.2 | IC1.15 v83.18,34.76
  Bottom 0.254: v83.18,34.76 112.39,34.76 113.66,33.49 v127.63,33.49
ADDR14  (via drill 0.61)
  Top 0.254: v130.17,50 136.52,43.65 136.52,36.03 135.25,34.76 IC9.3 | IC1.16 v80.64,42.38
  Bottom 0.254: v80.64,42.38 88.26,50 v130.17,50
ADDR15  (via drill 0.61)
  Top 0.254: 79.37,61.43 103.5,85.56 116.2,85.56 116.2,58.89 114.93,57.62 SV2.6 | 79.37,61.43 73.02,55.08 IC1.19 | v71.75,69.05 79.37,61.43 | IC8.11 v24.76,69.05
  Bottom 0.254: v24.76,69.05 v71.75,69.05 | SV2.1 111.12,38.57 113.66,38.57 SV2.6
CLEAR  (via drill 0.61)
  Top 0.254: v9.52,15.71 8.25,16.98 8.25,50 12.06,53.81 v12.06,85.56 | SV6.7 122.55,93.18 v73.02,93.18
  Bottom 0.254: v9.52,15.71 13.33,15.71 14.6,14.44 U$1.3 | v12.06,85.56 14.6,88.1 43.81,88.1 46.35,90.64 46.35,94.45 | 46.35,94.45 37.46,94.45 LED3.A | v73.02,93.18 71.75,94.45 46.35,94.45
DATA0
  Top 0.254: U$2.2 47.62,1.74 43.81,1.74 43.81,4.28 45.08,5.55 U$1.15
  Bottom 0.254: IC2.9 145.41,11.9 144.14,10.63 46.35,10.63 45.08,11.9 U$1.15
DATA1  (via drill 0.61)
  Top 0.254: v48.89,15.71 48.89,8.09 50.16,6.82 U$2.3 | v139.06,61.43 151.76,48.73 151.76,18.25 147.95,14.44 IC2.10 | v36.19,19.52 v36.19,61.43 | U$1.14 v42.54,19.52
  Bottom 0.254: v48.89,15.71 43.81,15.71 42.54,14.44 U$1.14 | v36.19,61.43 v139.06,61.43 | v42.54,19.52 v36.19,19.52
DATA2  (via drill 0.61)
  Top 0.254: v50.16,16.98 51.43,15.71 51.43,4.28 U$2.4
  Bottom 0.254: U$1.13 40,14.44 42.54,16.98 v50.16,16.98 147.95,16.98 150.49,14.44 IC2.11
DATA3  (via drill 0.61)
  Top 0.254: v53.97,6.82 55.24,5.55 U$2.5 | v123.82,85.56 153.03,56.35 IC2.13 | v46.35,85.56 37.46,76.67 37.46,48.73 41.27,44.92 41.27,34.76 v37.46,30.95 | U$1.12 v37.46,25.87
  Bottom 0.254: v53.97,6.82 52.7,6.82 50.16,9.36 40,9.36 37.46,11.9 U$1.12 | v46.35,85.56 v123.82,85.56 | v37.46,30.95 36.19,30.95 36.19,25.87 v37.46,25.87
DATA4  (via drill 0.61)
  Top 0.254: v40,6.82 34.92,11.9 U$1.11 | v57.78,5.55 U$2.6 57.78,1.74 64.13,1.74 v64.13,4.28 | v139.06,15.71 150.49,27.14 IC2.14 | v100.96,13.17 98.42,15.71 97.15,15.71 97.15,1.74 81.91,1.74 v81.91,4.28
  Bottom 0.254: v40,6.82 41.27,5.55 v57.78,5.55 | v139.06,15.71 121.28,15.71 118.74,13.17 v100.96,13.17 | v64.13,4.28 v81.91,4.28
DATA5  (via drill 0.61)
  Top 0.254: v32.38,4.28 U$1.10 | v128.9,70.32 149.22,50 149.22,30.95 147.95,29.68 IC2.15
  Bottom 0.254: U$2.7 59.05,1.74 34.92,1.74 v32.38,4.28 1.9,4.28 1.9,67.78 3.17,69.05 8.25,69.05 10.79,71.59 127.63,71.59 v128.9,70.32
DATA6  (via drill 0.61)
  Top 0.254: v32.38,23.33 32.38,16.98 29.84,14.44 U$1.9 | v57.78,23.33 62.86,18.25 | 62.86,18.25 U$2.8 | v146.68,50 146.68,30.95 145.41,29.68 IC2.16 | v65.4,57.62 62.86,55.08 62.86,18.25
  Bottom 0.254: v32.38,23.33 v57.78,23.33 | v146.68,50 139.06,57.62 v65.4,57.62
DATA7  (via drill 0.61)
  Top 0.254: v29.84,22.06 29.84,16.98 27.3,14.44 U$1.8 | U$2.9 65.4,20.79 v64.13,22.06 64.13,55.08 v65.4,56.35 | v144.14,50 144.14,30.95 142.87,29.68 IC2.17
  Bottom 0.254: v29.84,22.06 v64.13,22.06 | v144.14,50 139.06,55.08 79.37,55.08 78.1,56.35 v65.4,56.35
DMA_IN  (via drill 0.61)
  Top 0.254: v15.87,5.55 13.33,8.09 13.33,24.6 14.6,25.87 U$1.38 14.6,29.68 15.87,30.95 15.87,41.11 v18.41,43.65 | v97.15,63.97 78.1,44.92 v78.1,43.65 | v38.73,43.65 v40,42.38
  Bottom 0.254: R12.1 23.49,5.55 v15.87,5.55 | v97.15,63.97 SV6.5 | v78.1,43.65 76.83,42.38 56.51,42.38 55.24,41.11 51.43,41.11 50.16,42.38 v40,42.38 | v18.41,43.65 v38.73,43.65
DMA_OUT
  Top 0.254: U$1.37 17.14,27.14 15.87,25.87 15.87,8.09 R11.1 17.14,4.28 9.52,4.28 6.98,6.82 6.98,57.62 5.71,58.89 5.71,76.67 SV3.6
EF1  (via drill 0.61)
  Top 0.254: v45.08,33.49 42.54,36.03 42.54,38.57 JP4.2 42.54,41.11 42.54,44.92 v38.73,48.73 | v50.16,33.49 U$1.24 | v33.65,34.76 33.65,38.57 JP3.2 32.38,41.11 34.92,43.65 v34.92,48.73 | v23.49,34.76 22.22,36.03 22.22,38.57 JP2.2
  Bottom 0.254: v45.08,33.49 v50.16,33.49 | JP1.2 10.79,38.57 19.68,38.57 JP2.2 | v23.49,34.76 v33.65,34.76 | v34.92,48.73 v38.73,48.73
EF2  (via drill 0.61)
  Top 0.254: v52.7,43.65 U$1.23 | v23.49,42.38 JP2.4 | v34.92,42.38 JP3.4 | v46.35,43.65 JP4.4
  Bottom 0.254: v52.7,43.65 v46.35,43.65 40,43.65 38.73,42.38 v34.92,42.38 v23.49,42.38 14.6,42.38 JP1.4
EF3  (via drill 0.61)
  Top 0.254: v51.43,42.38 JP4.6 | v55.24,42.38 U$1.22 | JP1.6 14.6,42.38 v18.41,46.19 | JP2.6 28.57,42.38 v28.57,46.19
  Bottom 0.254: JP2.6 27.3,38.57 36.19,38.57 JP3.6 | v51.43,42.38 v55.24,42.38 52.7,44.92 29.84,44.92 v28.57,46.19 v18.41,46.19
EF4  (via drill 0.61)
  Top 0.254: v57.78,39.84 U$1.21
  Bottom 0.254: v57.78,39.84 JP4.8 50.16,41.11 38.73,41.11 | JP1.8 18.41,41.11 27.3,41.11 | 27.3,41.11 JP2.8 | 38.73,41.11 JP3.8 | 27.3,41.11 38.73,41.11
FEF  (via drill 0.61)
  Top 0.254: JP2.5 JP2.7 29.84,38.57 v29.84,46.19 | v78.1,52.54 v94.61,69.05
  Bottom 0.254: JP2.1 JP2.3 JP2.5 | v94.61,69.05 SV6.1 | v78.1,52.54 71.75,46.19 v29.84,46.19
GND  (via drill 0.61)
  Top 0.254: U$1.20 57.78,18.25 56.51,19.52 56.51,47.46 57.78,48.73 IC7.7 57.78,51.27 66.67,60.16 | 55.24,96.99 R18.1 70.48,96.99 70.48,93.18 71.75,91.91 R14.1 88.26,90.64 C8.2 | 55.24,96.99 R17.1 | IC6.5 57.78,75.4 56.51,76.67 56.51,79.21 55.24,80.48 IC6.11 55.24,96.99 | C6.2 66.67,27.14 66.67,60.16 | 66.67,60.16 66.67,67.78 62.86,71.59 IC6.7 | SV3.15 SV3.13 SV3.11 SV3.9 SV3.7 | SV3.1 SV3.3 SV3.5 | C7.2 C2.2 | IC8.7 v32.38,55.08 | C14.- 33.65,5.55 v33.65,19.52 | SV2.2 U1.4 | S1.4 156.84,90.64 SV6.2 155.57,67.78 155.57,16.98 153.03,14.44 IC2.12 | 127.63,69.05 C10.2 | 127.63,69.05 127.63,79.21 C11.2 | 126.36,58.89 126.36,62.7 127.63,63.97 127.63,69.05 | 126.36,58.89 C12.2 | 126.36,58.89 141.6,43.65 141.6,36.03 140.33,34.76 IC9.5
  Bottom 0.254: IC6.11 55.24,80.48 53.97,79.21 C4.2 38.73,74.13 C3.2 13.33,76.67 5.71,76.67 | IC6.7 62.86,75.4 61.59,76.67 59.05,76.67 57.78,75.4 IC6.5 | SV3.7 5.71,76.67 | 5.71,76.67 SV3.5 | 6.98,52.54 10.79,52.54 C9.2 27.3,55.08 29.84,52.54 31.11,52.54 32.38,51.27 IC8.7 | C2.2 6.98,52.54 | v32.38,55.08 C13.2 | v33.65,19.52 8.25,19.52 C7.2 | SV3.15 4.44,52.54 6.98,52.54 | 144.14,30.95 146.68,30.95 147.95,32.22 IC9.8 | 144.14,30.95 141.6,30.95 140.33,32.22 IC9.5 | IC1.1 70.48,22.06 71.75,23.33 92.07,23.33 93.34,22.06 IC1.10 117.47,20.79 118.74,22.06 C5.2 144.14,22.06 144.14,30.95 | C12.2 123.82,41.11 111.12,41.11 SV2.2 107.31,39.84 SV5.5 | U$2.30 144.14,3.01 153.03,11.9 IC2.12 | C8.2 C11.2 | SV6.2 155.57,67.78 C10.2
KEF  (via drill 0.61)
  Top 0.254: 45.08,37.3 JP4.3 JP4.5 | 45.08,37.3 JP4.1 | v38.73,62.7 40,61.43 40,48.73 45.08,43.65 45.08,37.3
  Bottom 0.254: JP4.5 JP4.7 | SV3.14 12.06,62.7 v38.73,62.7
LCLK  (via drill 0.61)
  Top 0.254: SV3.8 8.25,74.13 v8.25,51.27
  Bottom 0.254: IC8.6 29.84,51.27 28.57,52.54 20.95,52.54 19.68,51.27 IC8.2 19.68,48.73 18.41,47.46 12.06,47.46 v8.25,51.27
N0  (via drill 0.61)
  Top 0.254: v47.62,25.87 55.24,18.25 U$1.19 | v59.05,25.87 61.59,28.41 v61.59,43.65 | v117.47,51.27 117.47,4.28 U$2.29
  Bottom 0.254: v47.62,25.87 v59.05,25.87 | v61.59,43.65 62.86,44.92 81.91,44.92 88.26,51.27 v117.47,51.27
N1  (via drill 0.61)
  Top 0.254: v60.32,9.36 v60.32,11.9 | v106.04,11.9 113.66,4.28 U$2.28 | v52.7,9.36 U$1.18
  Bottom 0.254: v52.7,9.36 v60.32,9.36 | v60.32,11.9 v106.04,11.9
N2  (via drill 0.61)
  Top 0.254: v99.69,13.17 103.5,9.36 U$2.24
  Bottom 0.254: v99.69,13.17 61.59,13.17 59.05,15.71 51.43,15.71 50.16,14.44 U$1.17
N$1  (via drill 0.61)
  Top 0.254: v53.97,38.57 53.97,43.65 51.43,46.19 51.43,52.54 50.16,53.81 IC7.11
  Bottom 0.254: v53.97,38.57 100.96,38.57 SV5.3
N$2  (via drill 0.61)
  Top 0.254: SV1.1 154.3,94.45 155.57,95.72 S1.2 | U1.1 103.5,63.97 v103.5,81.75
  Bottom 0.254: R6.1 95.88,62.7 U1.1 | v103.5,81.75 104.77,83.02 SV1.1
N$3  (via drill 0.61)
  Top 0.254: R13.1 v65.4,77.94 69.21,74.13 v69.21,58.89 | IC6.4 v55.24,77.94
  Bottom 0.254: v55.24,77.94 v65.4,77.94 | v69.21,58.89 149.22,58.89 149.22,38.57 139.06,38.57 139.06,30.95 140.33,29.68 IC2.18
N$4
  Bottom 0.254: IC8.9 29.84,56.35 32.38,53.81 42.54,53.81 45.08,56.35 IC7.13
N$5  (via drill 0.61)
  Top 0.254: v71.75,93.18 R14.2
  Bottom 0.254: LED1.K v71.75,93.18
N$6  (via drill 0.61)
  Top 0.254: v94.61,70.32 97.15,67.78 97.15,65.24 98.42,63.97 98.42,38.57 SV5.1 | IC8.8 v32.38,70.32
  Bottom 0.254: v32.38,70.32 v94.61,70.32
N$7  (via drill 0.61)
  Top 0.254: v45.08,90.64 52.7,83.02 IC6.12
  Bottom 0.254: LED4.K 24.76,90.64 v45.08,90.64
N$8
  Bottom 0.254: LED4.A 23.49,96.99 R15.2
N$9
  Top 0.254: LED3.K 41.27,93.18 R17.2
N$10
  Bottom 0.254: LED2.K 55.24,89.37 R18.2
N$13
  Bottom 0.254: LED5.A 9.52,96.99 R16.2
N$14  (via drill 0.61)
  Top 0.254: v47.62,38.57 47.62,46.19 48.89,47.46 v48.89,52.54 | v74.29,52.54 102.23,80.48 102.23,83.02 103.5,84.29 104.77,84.29 U1.7
  Bottom 0.254: v47.62,38.57 42.54,38.57 42.54,37.3 41.27,36.03 18.41,36.03 12.06,29.68 U$1.39 | v48.89,52.54 v74.29,52.54
N$16
  Top 0.254: R9.2 59.05,60.16 57.78,58.89 IC7.8 | IC7.2 IC7.1 42.54,51.27 41.27,52.54 41.27,60.16 42.54,61.43 42.54,65.24 R8.1
  Bottom 0.254: R9.2 57.78,62.7 40,62.7 40,66.51 R8.1
N$18
  Top 0.254: IC7.3 47.62,51.27 46.35,52.54 46.35,63.97 47.62,65.24 Q1.2
  Bottom 0.254: IC7.3 IC7.4 IC7.5 | R9.1 48.89,66.51 47.62,65.24 Q1.2
N$20  (via drill 0.61)
  Top 0.254: v113.66,34.76 113.66,38.57 SV2.4
  Bottom 0.254: v113.66,34.76 127.63,34.76 128.9,36.03 136.52,36.03 137.79,34.76 IC9.4
N$21
  Top 0.254: IC7.9 IC7.10 52.7,65.24 Q1.1
  Bottom 0.254: R8.2 51.43,63.97 52.7,65.24 Q1.1
N$23  (via drill 0.61)
  Top 0.254: v28.57,47.46 v28.57,55.08
  Bottom 0.254: v28.57,47.46 23.49,47.46 22.22,48.73 IC8.3 | v28.57,55.08 29.84,53.81 31.11,53.81 32.38,52.54 36.19,52.54 41.27,47.46 53.97,47.46 55.24,48.73 IC7.6
N$25
  Bottom 0.254: LED5.K 8.25,84.29 61.59,84.29 62.86,83.02 IC6.8
N$27  (via drill 0.61)
  Top 0.254: R10.1 C2.1 4.44,50 4.44,16.98 v5.71,15.71 | v27.3,44.92 IC8.5
  Bottom 0.254: v5.71,15.71 8.25,15.71 9.52,14.44 U$1.1 | v27.3,44.92 9.52,44.92 C2.1
N$29  (via drill 0.61)
  Top 0.254: v123.82,37.3 120.01,33.49 v120.01,28.41
  Bottom 0.254: v123.82,37.3 127.63,37.3 128.9,38.57 131.44,38.57 132.71,39.84 IC9.15 | v120.01,28.41 117.47,25.87 SV4.16
N$30  (via drill 0.61)
  Top 0.254: v133.98,30.95 133.98,38.57 135.25,39.84 IC9.14
  Bottom 0.254: v133.98,30.95 113.66,30.95 112.39,29.68 112.39,25.87 SV4.14
N$31  (via drill 0.61)
  Top 0.254: v113.66,43.65 111.12,41.11 SV4.12
  Bottom 0.254: v113.66,43.65 136.52,43.65 137.79,42.38 IC9.13
N$32  (via drill 0.61)
  Top 0.254: SV4.10 v108.58,44.92
  Bottom 0.254: v108.58,44.92 137.79,44.92 140.33,42.38 IC9.12
N$33  (via drill 0.61)
  Top 0.254: v108.58,46.19 107.31,44.92 107.31,27.14 SV4.8
  Bottom 0.254: v108.58,46.19 139.06,46.19 142.87,42.38 IC9.11
N$34  (via drill 0.61)
  Top 0.254: v108.58,47.46 106.04,44.92 106.04,28.41 SV4.6
  Bottom 0.254: v108.58,47.46 140.33,47.46 145.41,42.38 IC9.10
N$35  (via drill 0.61)
  Top 0.254: v108.58,48.73 100.96,41.11 SV4.4
  Bottom 0.254: v108.58,48.73 147.95,48.73 IC9.9
N$36  (via drill 0.61)
  Top 0.254: v100.96,18.25 97.15,22.06 97.15,24.6 SV4.2
  Bottom 0.254: v100.96,18.25 149.22,18.25 149.22,36.03 146.68,36.03 145.41,34.76 IC9.7
N$37  (via drill 0.61)
  Top 0.254: SV4.5 SV4.7 SV4.9 SV4.11 SV4.13 | v89.53,53.81 97.15,46.19 97.15,29.68 99.69,27.14 99.69,24.6 | 99.69,24.6 SV4.1 | 99.69,24.6 SV4.3
  Bottom 0.254: SV4.13 SV4.15 | v89.53,53.81 50.16,53.81 47.62,56.35 IC7.12 | SV4.3 SV4.5
N$38  (via drill 0.61)
  Top 0.254: v141.6,25.87 141.6,30.95 142.87,32.22 IC9.6 | v113.66,29.68 112.39,30.95 SV2.3
  Bottom 0.254: v141.6,25.87 123.82,25.87 120.01,29.68 v113.66,29.68
Q  (via drill 0.61)
  Top 0.254: v29.84,15.71 31.11,16.98 31.11,71.59 46.35,86.83 47.62,86.83 47.62,85.56 50.16,83.02 IC6.13 | U$2.10 66.67,4.28 v66.67,6.82 | v56.51,6.82 56.51,1.74 48.89,1.74 v48.89,6.82
  Bottom 0.254: 28.57,15.71 v29.84,15.71 | 28.57,15.71 18.41,15.71 17.14,14.44 U$1.4 | v56.51,6.82 v66.67,6.82 | v48.89,6.82 47.62,8.09 31.11,8.09 28.57,10.63 28.57,15.71
SC0  (via drill 0.61)
  Top 0.254: v19.68,20.79 19.68,16.98 22.22,14.44 U$1.6 | v13.33,25.87 13.33,42.38 18.41,47.46 18.41,90.64 17.14,91.91 6.98,91.91 SV3.2
  Bottom 0.254: v19.68,20.79 14.6,25.87 v13.33,25.87
SC1
  Top 0.254: SV3.4 5.71,81.75 5.71,84.29 3.17,84.29 1.9,83.02 1.9,3.01 17.14,3.01 18.41,4.28 18.41,8.09 19.68,9.36 U$1.5
  Bottom 0.254: SV6.3 155.57,65.24 158.11,65.24 158.11,89.37 78.1,89.37 69.21,98.26 17.14,98.26 13.33,94.45 6.98,94.45 5.71,93.18 5.71,80.48 SV3.4
TPA  (via drill 0.61)
  Top 0.254: U$2.11 71.75,4.28 v71.75,32.22
  Bottom 0.254: U$1.34 24.76,29.68 27.3,32.22 v71.75,32.22 90.8,32.22 93.34,29.68 IC1.11
TPB  (via drill 0.61)
  Top 0.254: v38.73,20.79 38.73,30.95 40,32.22 48.89,32.22 48.89,34.76 50.16,36.03 v50.16,38.57 | v74.29,37.3 74.29,4.28 U$2.12
  Bottom 0.254: v38.73,20.79 27.3,20.79 U$1.33 | v50.16,38.57 52.7,38.57 53.97,37.3 v74.29,37.3
VCC  (via drill 0.61)
  Top 0.254: U$2.1 46.35,4.28 46.35,10.63 47.62,11.9 U$1.16 | R7.2 10.79,8.09 10.79,15.71 9.52,16.98 U$1.40 | R16.1 C3.1 | IC8.14 IC8.1 17.14,47.46 v12.06,42.38 | IC8.12 22.22,56.35 24.76,53.81 IC8.4 | IC6.14 47.62,80.48 C4.1 43.81,60.16 42.54,58.89 IC7.14 | IC8.10 R15.1 | C5.1 125.09,23.33 IC2.24 125.09,34.76 C12.1 125.09,37.3 125.09,66.51 | v128.9,37.3 128.9,38.57 130.17,39.84 IC9.16 | U1.3 U1.2 103.5,61.43 99.69,61.43 99.69,67.78 | 99.69,67.78 U1.8 | R6.2 99.69,67.78 | C11.1 125.09,76.67 125.09,66.51 | 125.09,66.51 C10.1 | v67.94,25.87 C6.1 | LED1.A 70.48,91.91 R13.2 IC1.20
  Bottom 0.254: U$2.1 38.73,3.01 C14.+ 34.92,6.82 R12.2 26.03,8.09 18.41,8.09 | C7.1 4.44,20.79 4.44,27.14 9.52,27.14 U$1.40 9.52,36.03 8.25,36.03 6.98,37.3 6.98,42.38 v12.06,42.38 | R7.2 13.33,8.09 18.41,8.09 | 18.41,8.09 R11.2 | R15.1 R16.1 | C9.1 15.87,52.54 17.14,51.27 IC8.1 | R10.2 17.14,56.35 IC8.14 17.14,58.89 18.41,60.16 23.49,60.16 | 27.3,58.89 26.03,60.16 23.49,60.16 | 23.49,60.16 22.22,58.89 IC8.12 | C13.1 43.81,52.54 46.35,55.08 46.35,60.16 43.81,60.16 | 43.81,60.16 42.54,58.89 IC7.14 | 27.3,58.89 28.57,60.16 43.81,60.16 | 27.3,58.89 IC8.10 | v128.9,37.3 127.63,36.03 C12.1 123.82,36.03 122.55,37.3 SV2.5 | C10.1 125.09,66.51 R6.2 | v67.94,25.87 69.21,27.14 70.48,27.14 IC1.20 | C11.1 C8.1 85.72,80.48 R13.2 69.21,79.21 55.24,79.21 53.97,77.94 47.62,77.94 42.54,72.86 14.6,72.86 C3.1
VEF  (via drill 0.61)
  Top 0.254: 38.73,37.3 JP3.7 | JP3.5 38.73,37.3 | v33.65,47.46 v33.65,61.43 | v37.46,47.46 37.46,42.38 38.73,41.11 38.73,37.3
  Bottom 0.254: JP3.1 JP3.3 JP3.5 | SV3.16 10.79,61.43 v33.65,61.43 | v37.46,47.46 v33.65,47.46
WAIT  (via drill 0.61)
  Top 0.254: v14.6,90.64 14.6,51.27 10.79,47.46 10.79,25.87 12.06,24.6 U$1.2 | v126.36,86.83 SV6.9 | v53.97,86.83 52.7,88.1 52.7,94.45 LED2.A
  Bottom 0.254: v14.6,90.64 18.41,94.45 32.38,94.45 34.92,96.99 38.73,96.99 40,95.72 LED2.A | v53.97,86.83 v126.36,86.83